# Altium schematic sheet [1]Schematic_Blocks.SchDoc
size 863 x 558 mm; SheetNumber: 1; SheetTotal: 8
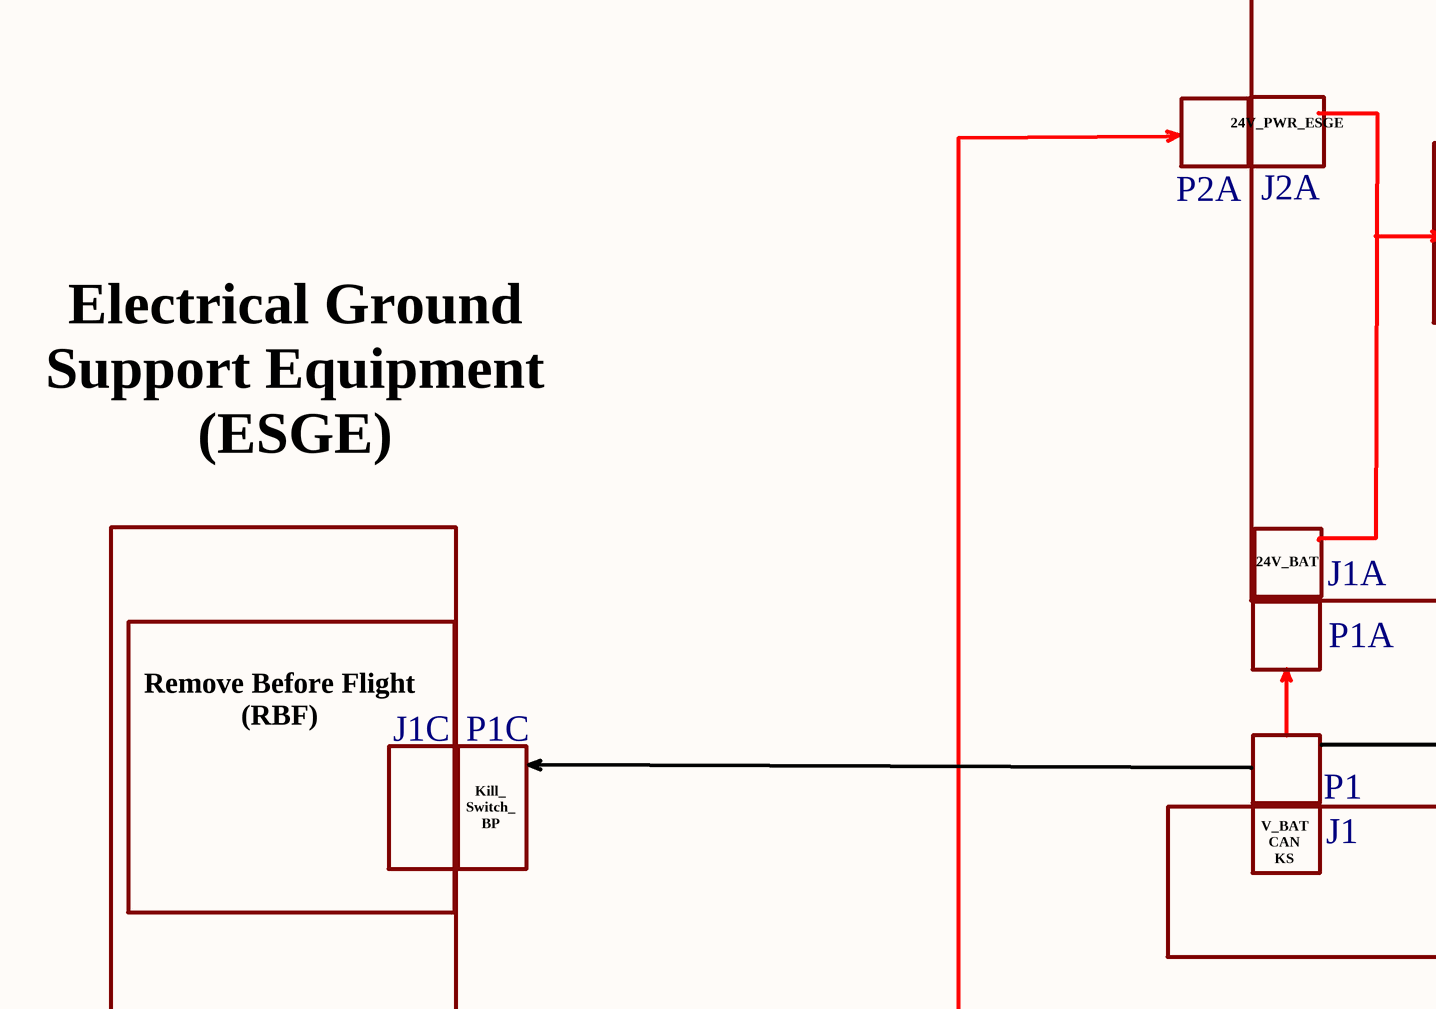
[diagram p0: [1]Schematic_Blocks.SchDoc, top left]
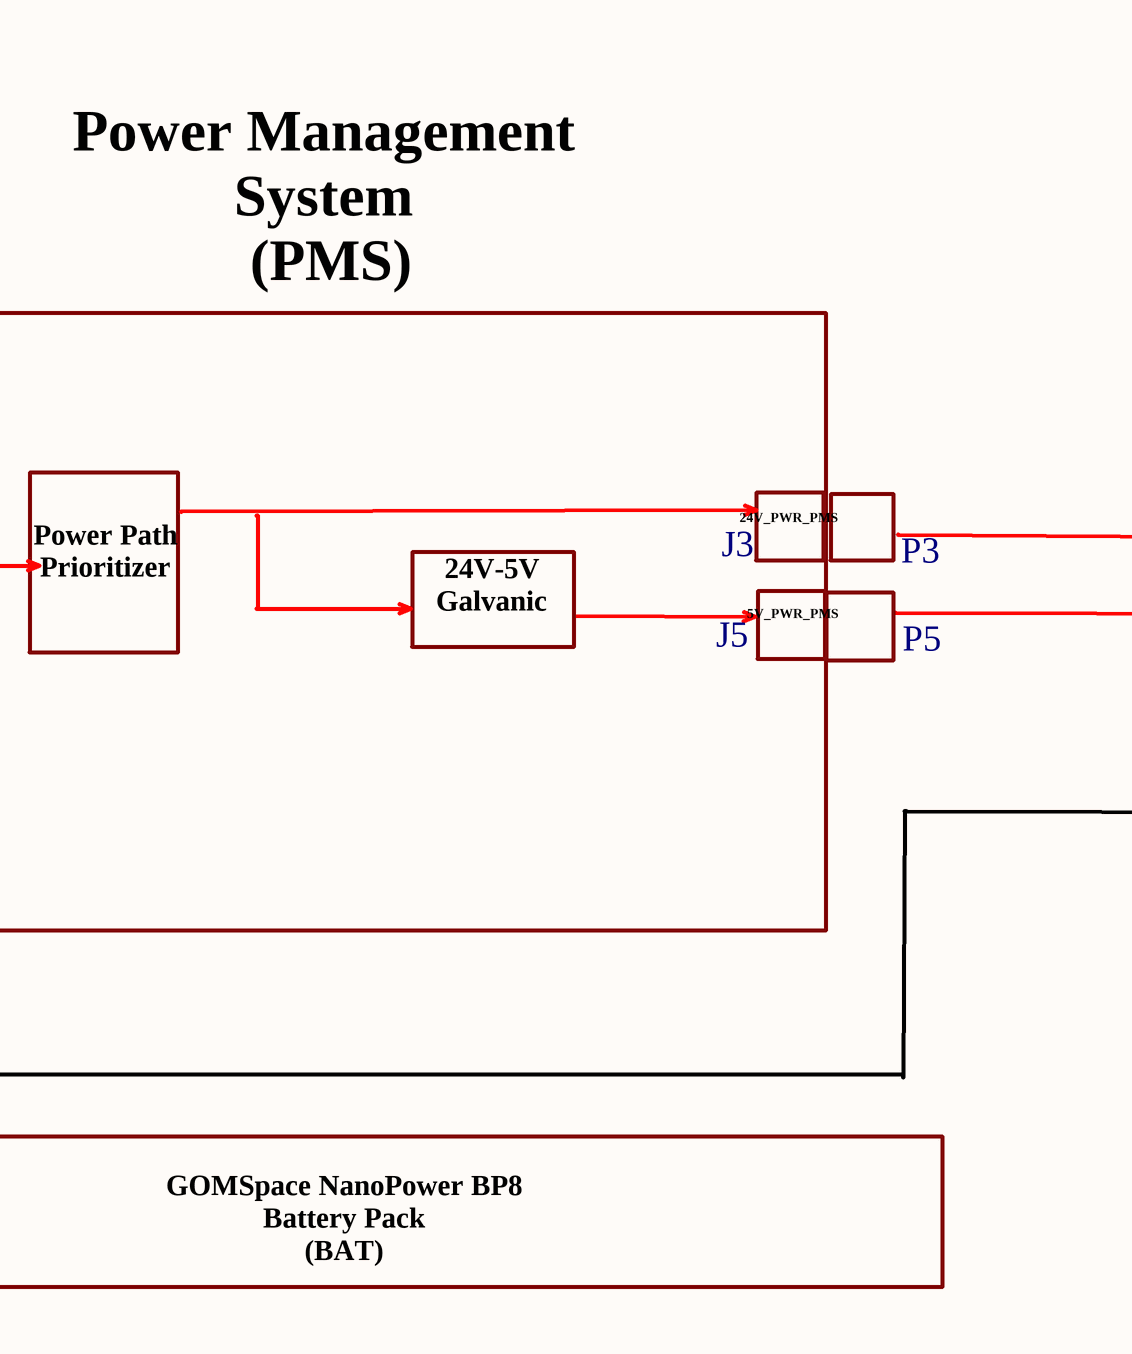
[diagram p1: [1]Schematic_Blocks.SchDoc, top middle]
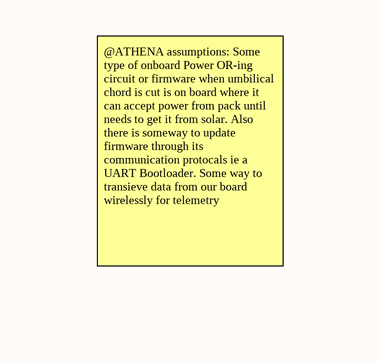
[diagram p2: [1]Schematic_Blocks.SchDoc, top right]
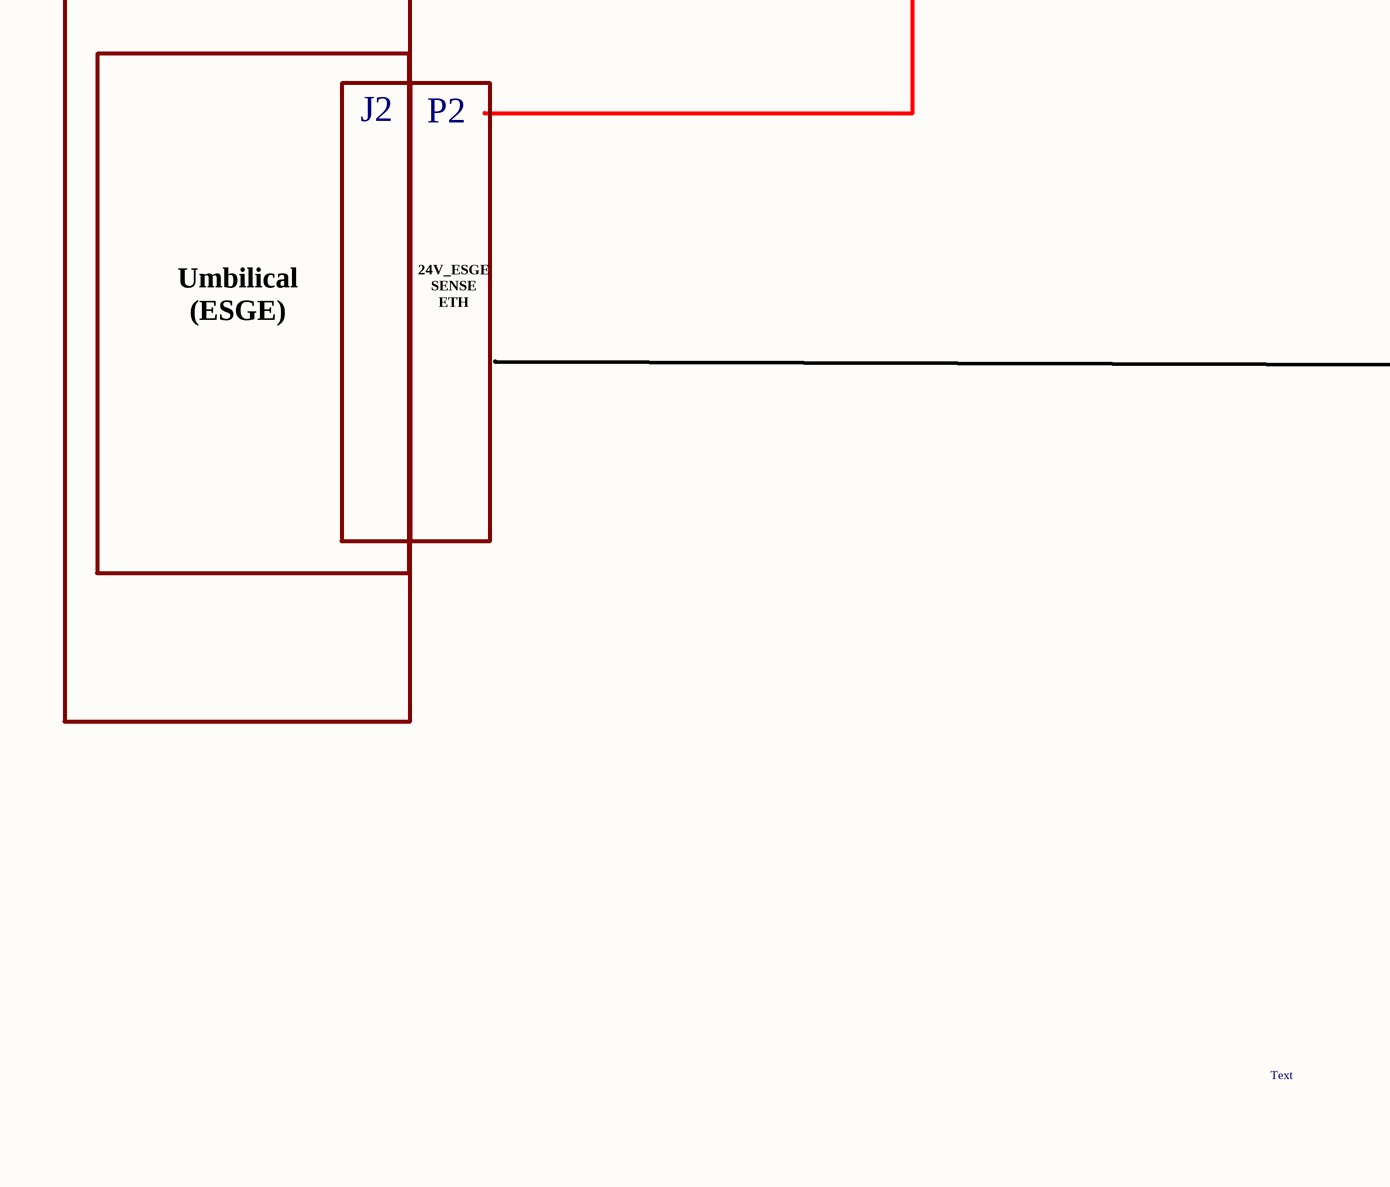
[diagram p3: [1]Schematic_Blocks.SchDoc, bottom left]
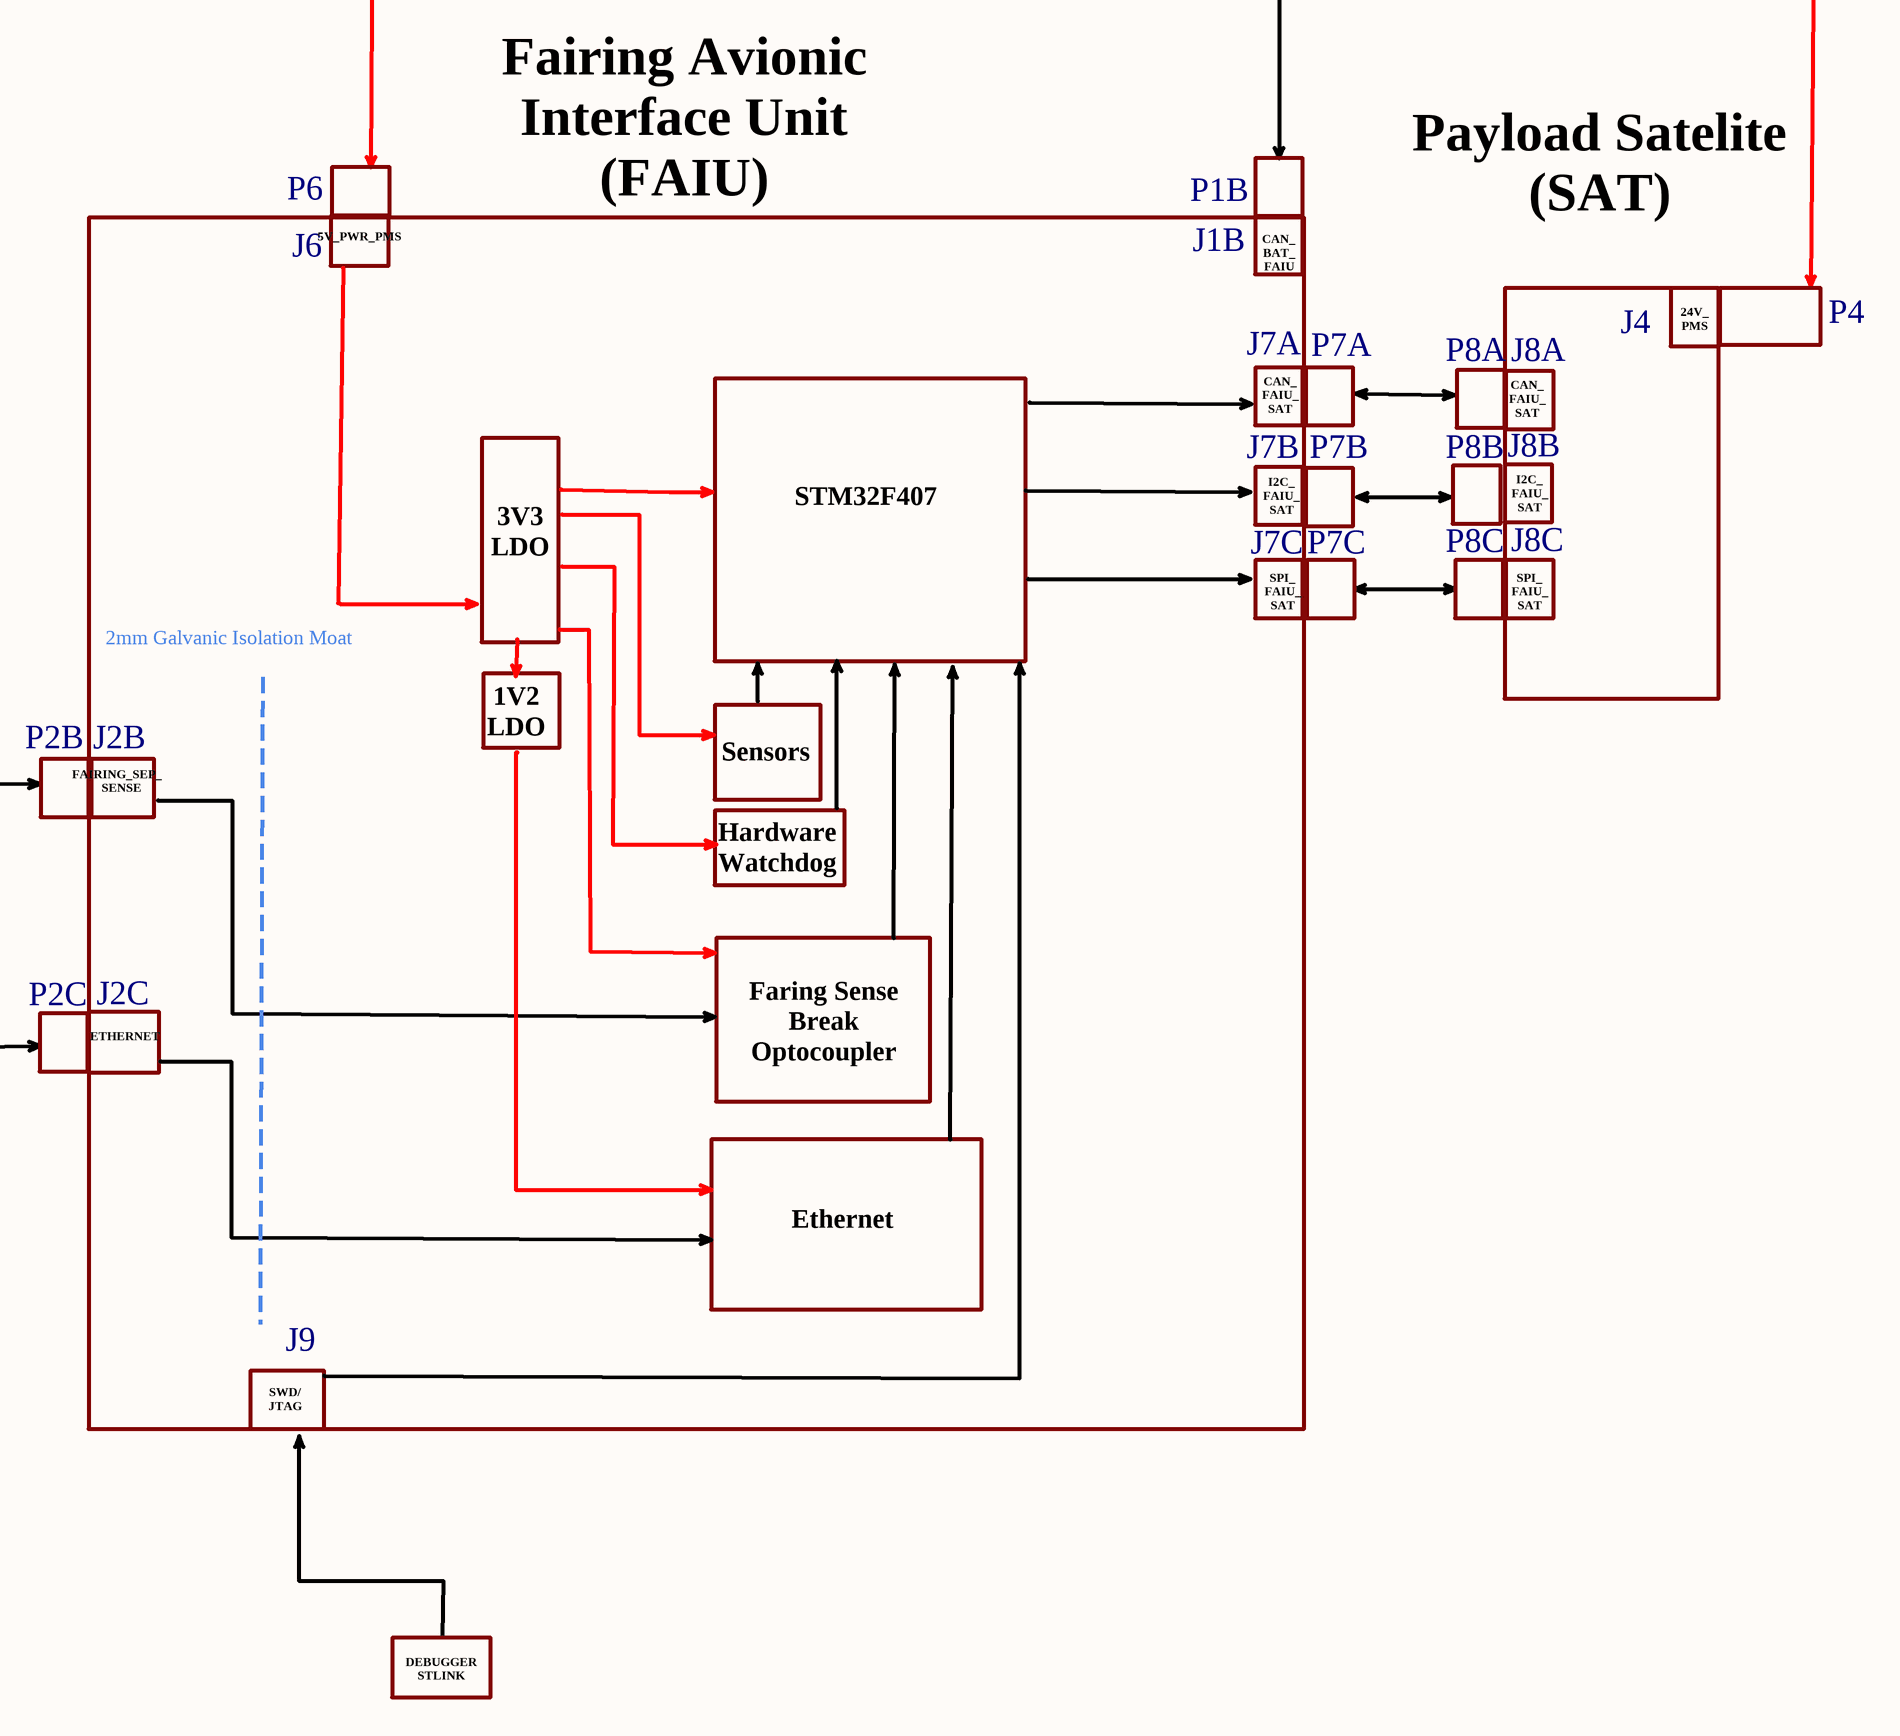
[diagram p4: [1]Schematic_Blocks.SchDoc, bottom right]

## Notes on the sheet
- @ATHENA assumptions: Some type of onboard Power OR-ing circuit or firmware when umbilical chord is cut is on board where it can accept power from pack until needs to get it from solar. Also there is someway to update firmware through its communication protocals ie a UART Bootloader. Some way to transieve data from our board wirelessly for telemetry
- Power Management System
  (PMS)
- P2A
- 24V_PWR_ESGE
- J2A
- J3
- 24V_PWR_PMS
- P3
- 24V-5V Galvanic Isolation
- J5
- 5V_PWR_PMS
- P5
- Power Path Prioritizer
- Electrical Ground Support Equipment
  (ESGE)
- 24V_BAT
- J1A
- P1A
- J1C
- P1C
- P6
- Fairing Avionic Interface Unit (FAIU)
- P1B
- P1
- J6
- J1B
- CAN_
  BAT_
  FAIU
- Payload Satelite (SAT)
- Remove Before Flight
  (RBF)
- Kill_
  Switch_
  BP
- V_BAT
  CAN
  KS
- J1
- J4
- P4
- GOMSpace NanoPower BP8 Battery Pack
  (BAT)
- J7A
- P7A
- P8A
- J8A
- 24V_
  PMS
- J7B
- CAN_
  FAIU_
  SAT
- P7B
- P8B
- J8B
- I2C_
  FAIU_
  SAT
- J2
- P2
- 3V3 LDO
- STM32F407
- J7C
- P7C
- P8C
- J8C
- 2mm Galvanic Isolation Moat
- SPI_
  FAIU_
  SAT
- 24V_ESGE
  SENSE
  ETH
- P2B
- J2B
- 1V2 LDO
- Umbilical
  (ESGE)
- FAIRING_SEP_
  SENSE
- Sensors
- Hardware Watchdog
- P2C
- J2C
- ETHERNET
- Faring Sense Break Optocoupler
- J9
- Ethernet
- Text
- SWD/
  JTAG
- DEBUGGER
  STLINK
- DWG. NO.
- REV.
- SHT.
- REVISION
- DESCRIPTION
- DATE
- APPROVED
- THIS DOCUMENT AND THE DATA DISCLOSED HEREIN OR HEREWITH IS THE PROPERTY OF ALTIUM LIMITED AND MAY BE FREELY DISTRIBUTED IN WHOLE. NO RIGHTS ARE RESERVED OR EXPRESS OR IMPLIED WARANTEE GIVEN.
- ENG:
- DSN:
- APPROVALS
- PROJECT
- DOCUMENT REVISION:
- DESIGN ITEM:
- CHK:
- BOM:
- REFERENCE DOCUMENTS
- PROJECT REVISION:
- TITLE
- FAB DWG:
- PCB DWG:
- ASSY DWG:
- SCALE:
- SIZE
- D
- CAGE CODE
- FILE NAME
- DWG NO.
- SHEET
- OF
- REV